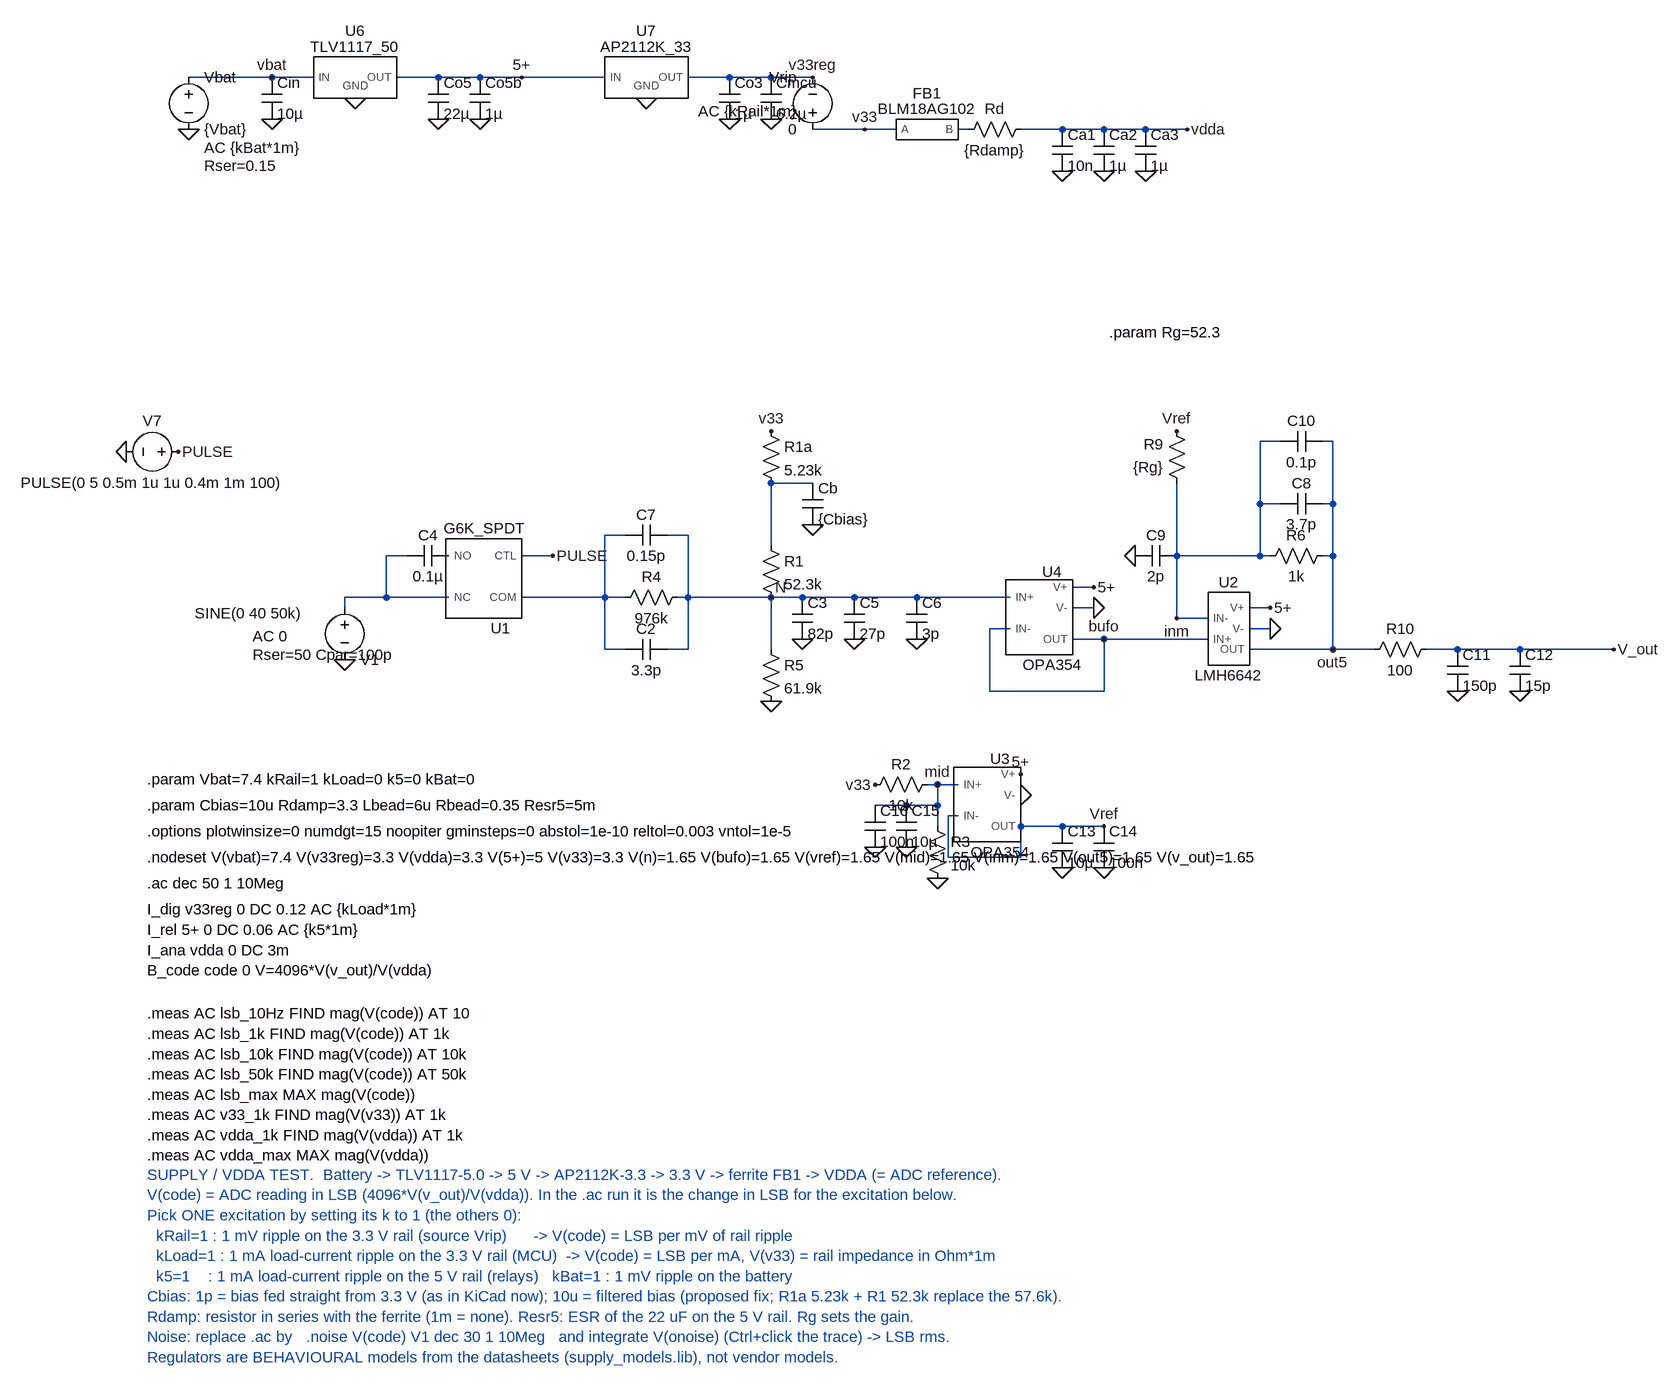
[diagram p0: schematic Analog Front End_supply.asc]
Analog Front End_supply.asc, the LTspice schematic file:
Version 4
SHEET 1 2400 1500
WIRE -112 -640 -240 -640
WIRE -48 -640 -112 -640
WIRE 144 -640 80 -640
WIRE 208 -640 144 -640
WIRE 272 -640 208 -640
WIRE 400 -640 272 -640
WIRE 592 -640 528 -640
WIRE 656 -640 592 -640
WIRE 720 -640 656 -640
WIRE 800 -560 720 -560
WIRE 848 -560 800 -560
WIRE 960 -560 944 -560
WIRE 1104 -560 1040 -560
WIRE 1168 -560 1104 -560
WIRE 1232 -560 1168 -560
WIRE 1296 -560 1232 -560
WIRE 1440 -80 1408 -80
WIRE 1520 -80 1504 -80
WIRE 720 -16 656 -16
WIRE 1408 16 1408 -80
WIRE 1440 16 1408 16
WIRE 1520 16 1520 -80
WIRE 1520 16 1504 16
WIRE 432 64 400 64
WIRE 528 64 496 64
WIRE 656 80 656 -16
WIRE 96 96 64 96
WIRE 320 96 272 96
WIRE 1280 96 1280 -16
WIRE 1408 96 1408 16
WIRE 1408 96 1280 96
WIRE 1424 96 1408 96
WIRE 1520 96 1520 16
WIRE 1520 96 1504 96
WIRE 1152 144 1120 144
WIRE 64 160 64 96
WIRE 64 160 0 160
WIRE 160 160 64 160
WIRE 400 160 400 64
WIRE 400 160 272 160
WIRE 432 160 400 160
WIRE 528 160 528 64
WIRE 528 160 512 160
WIRE 656 160 528 160
WIRE 704 160 656 160
WIRE 784 160 704 160
WIRE 880 160 784 160
WIRE 1024 160 880 160
WIRE 0 176 0 160
WIRE 1152 176 1120 176
WIRE 1424 176 1392 176
WIRE 1280 192 1280 96
WIRE 1328 192 1280 192
WIRE 1024 208 992 208
WIRE 1424 208 1392 208
WIRE 1168 224 1120 224
WIRE 1328 224 1168 224
WIRE 400 240 400 160
WIRE 432 240 400 240
WIRE 528 240 528 160
WIRE 528 240 496 240
WIRE 656 240 656 160
WIRE 1520 240 1520 96
WIRE 1520 240 1392 240
WIRE 1584 240 1520 240
WIRE 1712 240 1664 240
WIRE 1808 240 1712 240
WIRE 1952 240 1808 240
WIRE 992 304 992 208
WIRE 1168 304 1168 224
WIRE 1168 304 992 304
WIRE 912 448 896 448
WIRE 944 448 912 448
WIRE 864 480 816 480
WIRE 912 480 912 448
WIRE 912 480 864 480
WIRE 944 496 928 496
WIRE 912 512 912 480
WIRE 1104 512 1040 512
WIRE 1168 512 1104 512
WIRE 928 560 928 496
WIRE 1040 560 1040 512
WIRE 1040 560 928 560
FLAG 912 592 0
FLAG 656 320 0
FLAG 0 256 0
FLAG 1952 240 V_out
FLAG 704 224 0
FLAG -256 -64 PULSE
FLAG -336 -64 0
FLAG 320 96 PULSE
FLAG 784 224 0
FLAG 1152 144 5+
FLAG 1152 176 0
FLAG 880 224 0
FLAG 1424 176 5+
FLAG 1424 208 0
FLAG 1216 96 0
FLAG 1280 -96 Vref
FLAG 1712 304 0
FLAG 1808 304 0
FLAG 656 160 N
FLAG 1168 224 bufo
FLAG 1280 192 inm
FLAG 1520 240 out5
FLAG 912 448 mid
FLAG 816 448 v33
FLAG 1040 432 5+
FLAG 1040 464 0
FLAG 1168 512 Vref
FLAG 864 544 0
FLAG 816 544 0
FLAG 1104 576 0
FLAG 1168 576 0
FLAG 656 -96 v33
FLAG 720 48 0
FLAG -240 -560 0
FLAG -112 -576 0
FLAG -112 -640 vbat
FLAG 16 -608 0
FLAG 144 -576 0
FLAG 208 -576 0
FLAG 272 -640 5+
FLAG 464 -608 0
FLAG 592 -576 0
FLAG 656 -576 0
FLAG 720 -640 v33reg
FLAG 800 -560 v33
FLAG 1104 -496 0
FLAG 1168 -496 0
FLAG 1232 -496 0
FLAG 1296 -560 vdda
SYMBOL res 640 64 R0
SYMATTR InstName R1
SYMATTR Value 52.3k
SYMBOL res 912 432 R90
WINDOW 0 0 56 VBottom 2
WINDOW 3 32 56 VTop 2
SYMATTR InstName R2
SYMATTR Value 10k
SYMBOL res 896 496 R0
SYMATTR InstName R3
SYMATTR Value 10k
SYMBOL res 528 144 R90
WINDOW 0 0 56 VBottom 2
WINDOW 3 32 56 VTop 2
SYMATTR InstName R4
SYMATTR Value 976k
SYMBOL res 640 224 R0
SYMATTR InstName R5
SYMATTR Value 61.9k
SYMBOL voltage 0 160 R0
WINDOW 0 24 96 Left 2
WINDOW 3 -231 24 Left 2
WINDOW 123 -142 60 Left 2
WINDOW 39 -142 88 Left 2
SYMATTR InstName V1
SYMATTR Value SINE(0 40 50k)
SYMATTR Value2 AC 0
SYMATTR SpiceLine Rser=50 Cpar=100p
SYMBOL cap 688 160 R0
SYMATTR InstName C3
SYMATTR Value 82p
SYMATTR SpiceLine Rser=0.3 Lser=0.7n
SYMBOL LMH6642 1360 208 R0
SYMATTR InstName U2
SYMBOL voltage -240 -64 R90
WINDOW 0 -32 56 VBottom 2
WINDOW 3 32 56 VTop 2
WINDOW 123 0 0 Left 0
WINDOW 39 0 0 Left 0
SYMATTR InstName V7
SYMATTR Value PULSE(0 5 0.5m 1u 1u 0.4m 1m 100)
SYMBOL OPA354 1088 192 R0
SYMATTR InstName U4
SYMBOL G6K_SPDT 240 144 R180
SYMATTR InstName U1
SYMBOL cap 160 80 R90
WINDOW 0 0 32 VBottom 2
WINDOW 3 32 32 VTop 2
SYMATTR InstName C4
SYMATTR Value 0.1µ
SYMATTR SpiceLine V=100 Irms=0 Rser=0.03 Lser=0.8n Rpar=1G
SYMBOL cap 768 160 R0
SYMATTR InstName C5
SYMATTR Value 27p
SYMATTR SpiceLine Rser=1 Lser=1n
SYMBOL cap 496 224 R90
WINDOW 0 0 32 VBottom 2
WINDOW 3 32 32 VTop 2
SYMATTR InstName C2
SYMATTR Value 3.3p
SYMATTR SpiceLine Rser=1 Lser=0.5n
SYMBOL cap 496 48 R90
WINDOW 0 0 32 VBottom 2
WINDOW 3 32 32 VTop 2
SYMATTR InstName C7
SYMATTR Value 0.15p
SYMBOL cap 864 160 R0
SYMATTR InstName C6
SYMATTR Value 3p
SYMBOL res 1520 80 R90
WINDOW 0 0 56 VBottom 2
WINDOW 3 32 56 VTop 2
SYMATTR InstName R6
SYMATTR Value 1k
SYMBOL cap 1504 0 R90
WINDOW 0 0 32 VBottom 2
WINDOW 3 32 32 VTop 2
SYMATTR InstName C8
SYMATTR Value 3.7p
SYMATTR SpiceLine Rser=0.2 Lser=0.5n
SYMBOL cap 1280 80 R90
WINDOW 0 0 32 VBottom 2
WINDOW 3 32 32 VTop 2
SYMATTR InstName C9
SYMATTR Value 2p
SYMBOL cap 1504 -96 R90
WINDOW 0 0 32 VBottom 2
WINDOW 3 32 32 VTop 2
SYMATTR InstName C10
SYMATTR Value 0.1p
SYMBOL res 1296 0 R180
WINDOW 0 36 76 Left 2
WINDOW 3 36 40 Left 2
SYMATTR InstName R9
SYMATTR Value {Rg}
SYMBOL res 1680 224 R90
WINDOW 0 0 56 VBottom 2
WINDOW 3 32 56 VTop 2
SYMATTR InstName R10
SYMATTR Value 100
SYMBOL cap 1696 240 R0
SYMATTR InstName C11
SYMATTR Value 150p
SYMATTR SpiceLine Rser=0.2 Lser=0.7n
SYMBOL cap 1792 240 R0
SYMATTR InstName C12
SYMATTR Value 15p
SYMBOL OPA354 1008 480 R0
SYMATTR InstName U3
SYMBOL cap 848 480 R0
SYMATTR InstName C15
SYMATTR Value 10µ
SYMATTR SpiceLine Rser=0.02 Lser=1.5n
SYMBOL cap 800 480 R0
SYMATTR InstName C16
SYMATTR Value 100n
SYMATTR SpiceLine Rser=0.05 Lser=0.7n
SYMBOL cap 1088 512 R0
SYMATTR InstName C13
SYMATTR Value 10µ
SYMATTR SpiceLine Rser=0.02 Lser=1.5n
SYMBOL cap 1152 512 R0
SYMATTR InstName C14
SYMATTR Value 100n
SYMATTR SpiceLine Rser=0.05 Lser=0.7n
SYMBOL res 640 -112 R0
SYMATTR InstName R1a
SYMATTR Value 5.23k
SYMBOL cap 704 -16 R0
SYMATTR InstName Cb
SYMATTR Value {Cbias}
SYMBOL voltage -240 -656 R0
WINDOW 123 24 124 Left 2
WINDOW 39 24 152 Left 2
SYMATTR Value2 AC {kBat*1m}
SYMATTR SpiceLine Rser=0.15
SYMATTR InstName Vbat
SYMATTR Value {Vbat}
SYMBOL cap -128 -640 R0
SYMATTR InstName Cin
SYMATTR Value 10µ
SYMATTR SpiceLine Rser=5m Lser=1n
SYMBOL TLV1117_50 16 -640 R0
SYMATTR InstName U6
SYMBOL cap 128 -640 R0
SYMATTR InstName Co5
SYMATTR Value 22µ
SYMATTR SpiceLine Rser={Resr5} Lser=1n
SYMBOL cap 192 -640 R0
SYMATTR InstName Co5b
SYMATTR Value 1µ
SYMATTR SpiceLine Rser=5m Lser=0.7n
SYMBOL AP2112K_33 464 -640 R0
SYMATTR InstName U7
SYMBOL cap 576 -640 R0
SYMATTR InstName Co3
SYMATTR Value 1µ
SYMATTR SpiceLine Rser=5m Lser=0.7n
SYMBOL cap 640 -640 R0
SYMATTR InstName Cmcu
SYMATTR Value 6.2µ
SYMATTR SpiceLine Rser=3m Lser=0.5n
SYMBOL voltage 720 -544 R180
WINDOW 0 24 96 Left 2
WINDOW 3 24 16 Left 2
WINDOW 123 24 44 Left 2
WINDOW 39 0 0 Left 0
SYMATTR InstName Vrip
SYMATTR Value 0
SYMATTR Value2 AC {kRail*1m}
SYMBOL BLM18AG102 896 -560 R0
SYMATTR InstName FB1
SYMATTR SpiceLine L={Lbead} Rdc={Rbead}
SYMBOL res 1056 -576 R90
WINDOW 0 0 56 VBottom 2
WINDOW 3 32 56 VTop 2
SYMATTR InstName Rd
SYMATTR Value {Rdamp}
SYMBOL cap 1088 -560 R0
SYMATTR InstName Ca1
SYMATTR Value 10n
SYMATTR SpiceLine Rser=50m Lser=0.5n
SYMBOL cap 1152 -560 R0
SYMATTR InstName Ca2
SYMATTR Value 1µ
SYMATTR SpiceLine Rser=5m Lser=0.7n
SYMBOL cap 1216 -560 R0
SYMATTR InstName Ca3
SYMATTR Value 1µ
SYMATTR SpiceLine Rser=5m Lser=0.7n
TEXT 1176 -248 Left 2 !.param Rg=52.3
TEXT -304 520 Left 2 !.options plotwinsize=0 numdgt=15 noopiter gminsteps=0 abstol=1e-10 reltol=0.003 vntol=1e-5
TEXT -304 560 Left 2 !.nodeset V(vbat)=7.4 V(v33reg)=3.3 V(vdda)=3.3 V(5+)=5 V(v33)=3.3 V(n)=1.65 V(bufo)=1.65 V(vref)=1.65 V(mid)=1.65 V(inm)=1.65 V(out5)=1.65 V(v_out)=1.65
TEXT -304 440 Left 2 !.param Vbat=7.4 kRail=1 kLoad=0 k5=0 kBat=0
TEXT -304 480 Left 2 !.param Cbias=10u Rdamp=3.3 Lbead=6u Rbead=0.35 Resr5=5m
TEXT -304 600 Left 2 !.ac dec 50 1 10Meg
TEXT -304 640 Left 2 !I_dig v33reg 0 DC 0.12 AC {kLoad*1m}\nI_rel 5+ 0 DC 0.06 AC {k5*1m}\nI_ana vdda 0 DC 3m\nB_code code 0 V=4096*V(v_out)/V(vdda)
TEXT -304 800 Left 2 !.meas AC lsb_10Hz FIND mag(V(code)) AT 10\n.meas AC lsb_1k FIND mag(V(code)) AT 1k\n.meas AC lsb_10k FIND mag(V(code)) AT 10k\n.meas AC lsb_50k FIND mag(V(code)) AT 50k\n.meas AC lsb_max MAX mag(V(code))\n.meas AC v33_1k FIND mag(V(v33)) AT 1k\n.meas AC vdda_1k FIND mag(V(vdda)) AT 1k\n.meas AC vdda_max MAX mag(V(vdda))
TEXT -304 1048 Left 2 ;SUPPLY / VDDA TEST.  Battery -> TLV1117-5.0 -> 5 V -> AP2112K-3.3 -> 3.3 V -> ferrite FB1 -> VDDA (= ADC reference).\nV(code) = ADC reading in LSB (4096*V(v_out)/V(vdda)). In the .ac run it is the change in LSB for the excitation below.\nPick ONE excitation by setting its k to 1 (the others 0):\n  kRail=1 : 1 mV ripple on the 3.3 V rail (source Vrip)      -> V(code) = LSB per mV of rail ripple\n  kLoad=1 : 1 mA load-current ripple on the 3.3 V rail (MCU)  -> V(code) = LSB per mA, V(v33) = rail impedance in Ohm*1m\n  k5=1    : 1 mA load-current ripple on the 5 V rail (relays)   kBat=1 : 1 mV ripple on the battery\nCbias: 1p = bias fed straight from 3.3 V (as in KiCad now); 10u = filtered bias (proposed fix; R1a 5.23k + R1 52.3k replace the 57.6k).\nRdamp: resistor in series with the ferrite (1m = none). Resr5: ESR of the 22 uF on the 5 V rail. Rg sets the gain.\nNoise: replace .ac by   .noise V(code) V1 dec 30 1 10Meg   and integrate V(onoise) (Ctrl+click the trace) -> LSB rms.\nRegulators are BEHAVIOURAL models from the datasheets (supply_models.lib), not vendor models.

The netlist it stands for:
* Analog Front End_supply.asc
R1 N002 N 52.3k
R2 mid v33 10k
R3 mid 0 10k
R4 N N003 976k
R5 N 0 61.9k
V1 N004 0 SINE(0 40 50k) AC 0 Rser=50 Cpar=100p
C3 N 0 82p Rser=0.3 Lser=0.7n
XU2 inm bufo 5+ 0 out5 LMH6642  ; pins IN- IN+ V+ V- OUT
V7 PULSE 0 PULSE(0 5 0.5m 1u 1u 0.4m 1m 100)
XU4 N bufo 5+ 0 bufo OPA354  ; pins IN+ IN- V+ V- OUT
XU1 N003 N004 P001 PULSE G6K_SPDT  ; pins COM NC NO CTL
C4 P001 N004 0.1µ V=100 Irms=0 Rser=0.03 Lser=0.8n Rpar=1G
C5 N 0 27p Rser=1 Lser=1n
C2 N N003 3.3p Rser=1 Lser=0.5n
C7 N N003 0.15p
C6 N 0 3p
R6 out5 inm 1k
C8 out5 inm 3.7p Rser=0.2 Lser=0.5n
C9 inm 0 2p
C10 out5 inm 0.1p
R9 inm Vref {Rg}
R10 V_out out5 100
C11 V_out 0 150p Rser=0.2 Lser=0.7n
C12 V_out 0 15p
XU3 mid Vref 5+ 0 Vref OPA354  ; pins IN+ IN- V+ V- OUT
C15 mid 0 10µ Rser=0.02 Lser=1.5n
C16 mid 0 100n Rser=0.05 Lser=0.7n
C13 Vref 0 10µ Rser=0.02 Lser=1.5n
C14 Vref 0 100n Rser=0.05 Lser=0.7n
R1a v33 N002 5.23k
Cb N002 0 {Cbias}
Vbat vbat 0 {Vbat} AC {kBat*1m} Rser=0.15
Cin vbat 0 10µ Rser=5m Lser=1n
XU6 vbat 5+ 0 TLV1117_50  ; pins IN OUT GND
Co5 5+ 0 22µ Rser={Resr5} Lser=1n
Co5b 5+ 0 1µ Rser=5m Lser=0.7n
XU7 5+ v33reg 0 AP2112K_33  ; pins IN OUT GND
Co3 v33reg 0 1µ Rser=5m Lser=0.7n
Cmcu v33reg 0 6.2µ Rser=3m Lser=0.5n
Vrip v33 v33reg 0 AC {kRail*1m}
XFB1 v33 N001 BLM18AG102 L={Lbead} Rdc={Rbead}  ; pins A B
Rd vdda N001 {Rdamp}
Ca1 vdda 0 10n Rser=50m Lser=0.5n
Ca2 vdda 0 1µ Rser=5m Lser=0.7n
Ca3 vdda 0 1µ Rser=5m Lser=0.7n
.param Rg=52.3
.options plotwinsize=0 numdgt=15 noopiter gminsteps=0 abstol=1e-10 reltol=0.003 vntol=1e-5
.nodeset V(vbat)=7.4 V(v33reg)=3.3 V(vdda)=3.3 V(5+)=5 V(v33)=3.3 V(n)=1.65 V(bufo)=1.65 V(vref)=1.65 V(mid)=1.65 V(inm)=1.65 V(out5)=1.65 V(v_out)=1.65
.param Vbat=7.4 kRail=1 kLoad=0 k5=0 kBat=0
.param Cbias=10u Rdamp=3.3 Lbead=6u Rbead=0.35 Resr5=5m
.ac dec 50 1 10Meg
I_dig v33reg 0 DC 0.12 AC {kLoad*1m}
I_rel 5+ 0 DC 0.06 AC {k5*1m}
I_ana vdda 0 DC 3m
B_code code 0 V=4096*V(v_out)/V(vdda)
.meas AC lsb_10Hz FIND mag(V(code)) AT 10
.meas AC lsb_1k FIND mag(V(code)) AT 1k
.meas AC lsb_10k FIND mag(V(code)) AT 10k
.meas AC lsb_50k FIND mag(V(code)) AT 50k
.meas AC lsb_max MAX mag(V(code))
.meas AC v33_1k FIND mag(V(v33)) AT 1k
.meas AC vdda_1k FIND mag(V(vdda)) AT 1k
.meas AC vdda_max MAX mag(V(vdda))
* SUPPLY / VDDA TEST.  Battery -> TLV1117-5.0 -> 5 V -> AP2112K-3.3 -> 3.3 V -> ferrite FB1 -> VDDA (= ADC reference).
* V(code) = ADC reading in LSB (4096*V(v_out)/V(vdda)). In the .ac run it is the change in LSB for the excitation below.
* Pick ONE excitation by setting its k to 1 (the others 0):
*   kRail=1 : 1 mV ripple on the 3.3 V rail (source Vrip)      -> V(code) = LSB per mV of rail ripple
*   kLoad=1 : 1 mA load-current ripple on the 3.3 V rail (MCU)  -> V(code) = LSB per mA, V(v33) = rail impedance in Ohm*1m
*   k5=1    : 1 mA load-current ripple on the 5 V rail (relays)   kBat=1 : 1 mV ripple on the battery
* Cbias: 1p = bias fed straight from 3.3 V (as in KiCad now); 10u = filtered bias (proposed fix; R1a 5.23k + R1 52.3k replace the 57.6k).
* Rdamp: resistor in series with the ferrite (1m = none). Resr5: ESR of the 22 uF on the 5 V rail. Rg sets the gain.
* Noise: replace .ac by   .noise V(code) V1 dec 30 1 10Meg   and integrate V(onoise) (Ctrl+click the trace) -> LSB rms.
* Regulators are BEHAVIOURAL models from the datasheets (supply_models.lib), not vendor models.
.lib C:\Users\polus\OneDrive\Pulpit\Projekty\Oscyloskop\Symulacje\LMH6642.MOD
.lib C:\Users\polus\OneDrive\Pulpit\Projekty\Oscyloskop\Symulacje\sboc018c\OPA354-PSpiceFiles\SCHEMATIC1\TransientSimulation\OPA354.lib
.lib C:\Users\polus\OneDrive\Pulpit\Projekty\Oscyloskop\Symulacje\G6K_SPDT.lib
.lib C:\Users\polus\OneDrive\Pulpit\Projekty\Oscyloskop\Symulacje\supply_models.lib
.backanno
.end